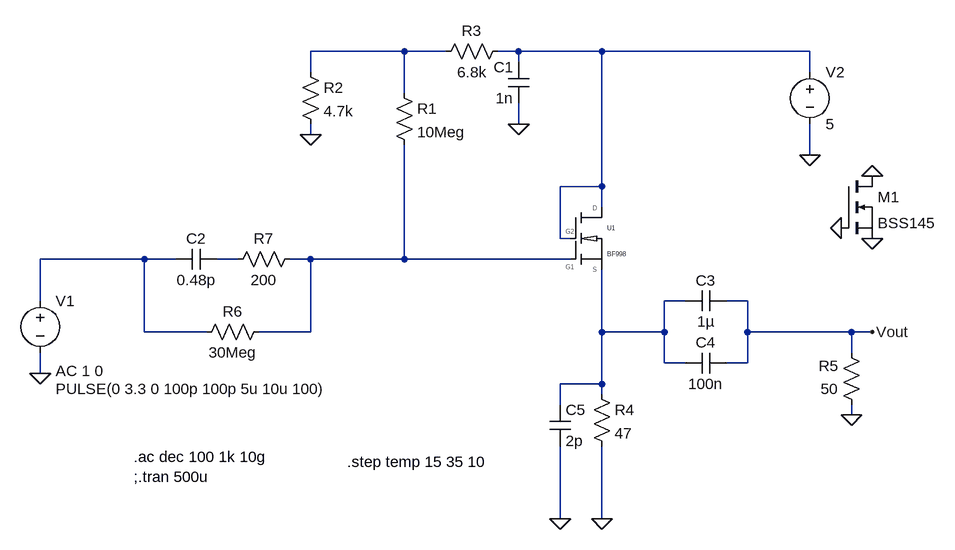
[diagram p0: schematic input_fet_bf998.asc]
input_fet_bf998.asc, the LTspice schematic file:
Version 4
SHEET 1 880 680
WIRE -80 -112 -224 -112
WIRE -16 -112 -80 -112
WIRE 96 -112 64 -112
WIRE 224 -112 96 -112
WIRE 544 -112 224 -112
WIRE 96 -96 96 -112
WIRE -224 -80 -224 -112
WIRE 544 -80 544 -112
WIRE -80 -48 -80 -112
WIRE 96 0 96 -32
WIRE -224 16 -224 0
WIRE 544 48 544 0
WIRE 224 96 224 -112
WIRE 224 96 160 96
WIRE 224 128 224 96
WIRE 160 176 160 96
WIRE 176 176 160 176
WIRE -480 208 -640 208
WIRE -432 208 -480 208
WIRE -336 208 -368 208
WIRE -224 208 -256 208
WIRE -80 208 -80 32
WIRE -80 208 -224 208
WIRE 176 208 -80 208
WIRE -640 272 -640 208
WIRE 352 272 320 272
WIRE 448 272 416 272
WIRE -480 320 -480 208
WIRE -384 320 -480 320
WIRE -224 320 -224 208
WIRE -224 320 -304 320
WIRE 224 320 224 224
WIRE 320 320 320 272
WIRE 320 320 224 320
WIRE 448 320 448 272
WIRE 608 320 448 320
WIRE 640 320 608 320
WIRE 608 352 608 320
WIRE 320 368 320 320
WIRE 352 368 320 368
WIRE 448 368 448 320
WIRE 448 368 416 368
WIRE -640 384 -640 352
WIRE 224 400 224 320
WIRE 224 400 160 400
WIRE 224 416 224 400
WIRE 160 432 160 400
WIRE 608 448 608 432
WIRE 160 608 160 496
WIRE 224 608 224 496
FLAG 224 608 0
FLAG 608 448 0
FLAG 160 608 0
FLAG -640 384 0
FLAG 544 48 0
FLAG 96 0 0
FLAG -224 16 0
FLAG 640 320 Vout
FLAG 640 176 0
FLAG 592 160 0
FLAG 640 80 0
DATAFLAG 240 -112 ""
DATAFLAG -80 -112 ""
SYMBOL res -96 -64 R0
SYMATTR InstName R1
SYMATTR Value 10Meg
SYMBOL res -240 -96 R0
SYMATTR InstName R2
SYMATTR Value 4.7k
SYMBOL res 80 -128 R90
WINDOW 0 0 56 VBottom 2
WINDOW 3 32 56 VTop 2
SYMATTR InstName R3
SYMATTR Value 6.8k
SYMBOL res 208 400 R0
SYMATTR InstName R4
SYMATTR Value 47
SYMBOL res 624 448 R180
WINDOW 0 36 76 Left 2
WINDOW 3 36 40 Left 2
SYMATTR InstName R5
SYMATTR Value 50
SYMBOL res -288 304 R90
WINDOW 0 0 56 VBottom 2
WINDOW 3 32 56 VTop 2
SYMATTR InstName R6
SYMATTR Value 30Meg
SYMBOL res -240 192 R90
WINDOW 0 0 56 VBottom 2
WINDOW 3 32 56 VTop 2
SYMATTR InstName R7
SYMATTR Value 200
SYMBOL cap 112 -32 R180
WINDOW 0 24 56 Left 2
WINDOW 3 24 8 Left 2
SYMATTR InstName C1
SYMATTR Value 1n
SYMBOL cap -432 224 R270
WINDOW 0 32 32 VTop 2
WINDOW 3 0 32 VBottom 2
SYMATTR InstName C2
SYMATTR Value 0.48p
SYMBOL cap 352 288 R270
WINDOW 0 32 32 VTop 2
WINDOW 3 0 32 VBottom 2
SYMATTR InstName C3
SYMATTR Value 1µ
SYMBOL cap 352 384 R270
WINDOW 0 32 32 VTop 2
WINDOW 3 0 32 VBottom 2
SYMATTR InstName C4
SYMATTR Value 100n
SYMBOL cap 144 432 R0
SYMATTR InstName C5
SYMATTR Value 2p
SYMBOL voltage -640 256 R0
WINDOW 3 24 152 Left 2
WINDOW 123 24 124 Left 2
WINDOW 39 0 0 Left 0
SYMATTR Value PULSE(0 3.3 0 100p 100p 5u 10u 100)
SYMATTR Value2 AC 1 0
SYMATTR InstName V1
SYMBOL voltage 544 -96 R0
WINDOW 123 0 0 Left 0
WINDOW 39 0 0 Left 0
SYMATTR InstName V2
SYMATTR Value 5
SYMBOL my\\BF998 176 128 R0
SYMATTR InstName U1
SYMBOL nmos 592 80 R0
SYMATTR InstName M1
SYMATTR Value BSS145
TEXT -496 512 Left 2 !.ac dec 100 1k 10g\n;.tran 500u
TEXT -168 520 Left 2 !.step temp 15 35 10

The netlist it stands for:
* input_fet_bf998.asc
R1 N001 N005 10Meg
R2 N001 0 4.7k
R3 N002 N001 6.8k
R4 N006 0 47
R5 0 Vout 50
R6 N005 N003 30Meg
R7 N005 N004 200
C1 0 N002 1n
C2 N003 N004 0.48p
C3 N006 Vout 1µ
C4 N006 Vout 100n
C5 N006 0 2p
V1 N003 0 PULSE(0 3.3 0 100p 100p 5u 10u 100) AC 1 0
V2 N002 0 5
XU1 N006 N002 N002 N005 BF998  ; pins S D G2 G1
M1 0 0 0 0 BSS145
.model NMOS NMOS
.model PMOS PMOS
.lib standard.mos
.ac dec 100 1k 10g
;.tran 500u
.step temp 15 35 10
.lib BF998.sub
.backanno
.end